# Altium project 数码管灯.PrjPcb
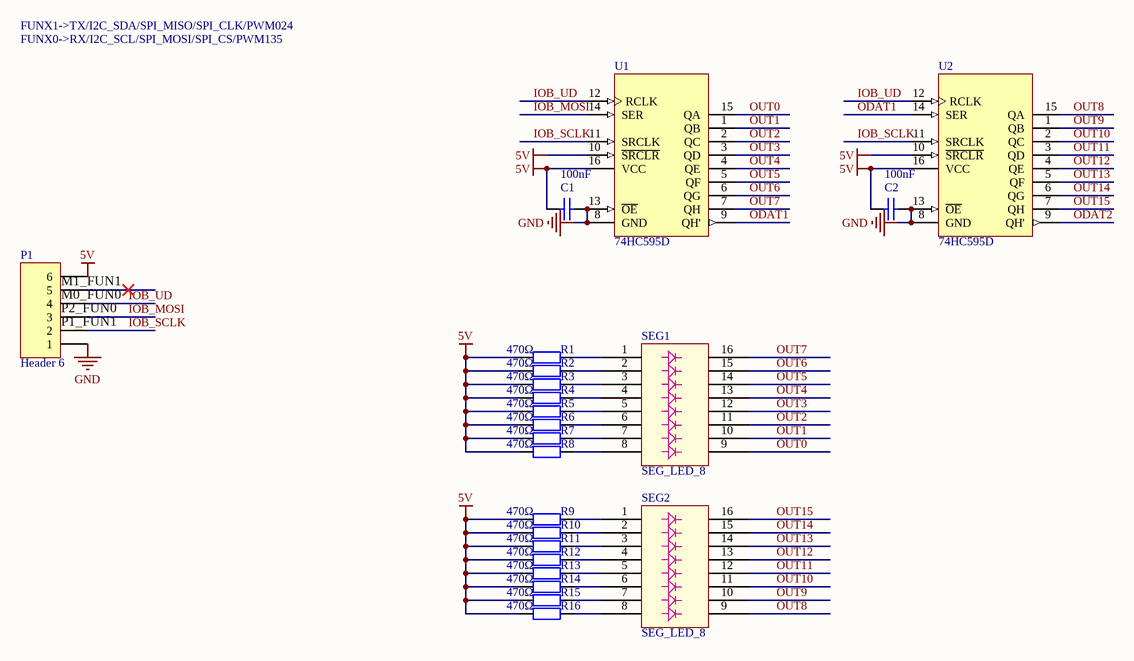
[diagram p0: 数码管灯.SchDoc]
1 sheet, 23 parts. Net scope: global (net labels, ports and power ports of the same name join across sheets).
Board file: 数码管灯.PcbDoc

## Sheet 数码管灯.SchDoc
size A4

### Parts
C1  100nF  [LC-0603_C]
C2  100nF  [LC-0603_C]
P1  Header 6  [MX 1.25-LS-6P]
R1  470Ω  [LC-0805_R]
R2  470Ω  [LC-0805_R]
R3  470Ω  [LC-0805_R]
R4  470Ω  [LC-0805_R]
R5  470Ω  [LC-0805_R]
R6  470Ω  [LC-0805_R]
R7  470Ω  [LC-0805_R]
R8  470Ω  [LC-0805_R]
R9  470Ω  [LC-0805_R]
R10  470Ω  [LC-0805_R]
R11  470Ω  [LC-0805_R]
R12  470Ω  [LC-0805_R]
R13  470Ω  [LC-0805_R]
R14  470Ω  [LC-0805_R]
R15  470Ω  [LC-0805_R]
R16  470Ω  [LC-0805_R]
SEG1  SEG_LED_8  [SEG_LEDx8]
SEG2  SEG_LED_8  [SEG_LEDx8]
U1  74HC595D  [LC-SOIC-16_150mil-3D]
U2  74HC595D  [LC-SOIC-16_150mil-3D]

### Nets
5V: C1.2 C2.2 P1.6 R1.1 R2.1 R3.1 R4.1 R5.1 R6.1 R7.1 R8.1 R9.1 R10.1 R11.1 R12.1 R13.1 R14.1 R15.1 R16.1 U1.10(~{SRCLR}) U1.16(VCC) U2.10(~{SRCLR}) U2.16(VCC)
GND: C1.1 C2.1 P1.1 U1.8(GND) U1.13(~{OE}) U2.8(GND) U2.13(~{OE})
IOB_MOSI: P1.3 U1.14(SER)
IOB_SCLK: P1.2 U1.11(SRCLK) U2.11(SRCLK)
IOB_UD: P1.4 U1.12(RCLK) U2.12(RCLK)
ODAT1: U1.9(QH') U2.14(SER)
ODAT2: U2.9(QH')
OUT0: SEG1.9 U1.15(QA)
OUT1: SEG1.10 U1.1(QB)
OUT2: SEG1.11 U1.2(QC)
OUT3: SEG1.12 U1.3(QD)
OUT4: SEG1.13 U1.4(QE)
OUT5: SEG1.14 U1.5(QF)
OUT6: SEG1.15 U1.6(QG)
OUT7: SEG1.16 U1.7(QH)
OUT8: SEG2.9 U2.15(QA)
OUT9: SEG2.10 U2.1(QB)
OUT10: SEG2.11 U2.2(QC)
OUT11: SEG2.12 U2.3(QD)
OUT12: SEG2.13 U2.4(QE)
OUT13: SEG2.14 U2.5(QF)
OUT14: SEG2.15 U2.6(QG)
OUT15: SEG2.16 U2.7(QH)
NetR1_2: R1.2 SEG1.1
NetR2_2: R2.2 SEG1.2
NetR3_2: R3.2 SEG1.3
NetR4_2: R4.2 SEG1.4
NetR5_2: R5.2 SEG1.5
NetR6_2: R6.2 SEG1.6
NetR7_2: R7.2 SEG1.7
NetR8_2: R8.2 SEG1.8
NetR9_2: R9.2 SEG2.1
NetR10_2: R10.2 SEG2.2
NetR11_2: R11.2 SEG2.3
NetR12_2: R12.2 SEG2.4
NetR13_2: R13.2 SEG2.5
NetR14_2: R14.2 SEG2.6
NetR15_2: R15.2 SEG2.7
NetR16_2: R16.2 SEG2.8

Not connected (* = marked no-connect by the designer): P1 5*

### Notes on the sheet
- FUNX1->TX/I2C_SDA/SPI_MISO/SPI_CLK/PWM024
- FUNX0->RX/I2C_SCL/SPI_MOSI/SPI_CS/PWM135
- (near P1) M0_FUN0
- (near P1) M1_FUN1
- (near P1) P1_FUN1
- (near P1) P2_FUN0

### Library data of the parts
C1 C2 = 0603 100nF (104) 10% 50V: 贴片电容; ComponentLink1Description: 供应商链接; ComponentLink1URL: http://www.szlcsc.com/product/details_15331.html; Package: 0603; Supplier: LC; SuppliersPartNumber: C14663
P1 = Header 6: Header, 6-Pin; LatestRevisionDate: 17-Jul-2002; LatestRevisionNote: Re-released for DXP Platform.; Publisher: Altium Limited
R1-R16 = 0805 470Ω (4700) 1%: 贴片电阻; ComponentLink1Description: 供应商链接; ComponentLink1URL: http://www.szlcsc.com/product/details_18398.html; Package: 0805; Supplier: LC; SuppliersPartNumber: C17710
U1 U2 = 74HC595D: 74系列逻辑芯片; ComponentLink1Description: 供应商链接; ComponentLink1URL: http://www.szlcsc.com/product/details_6413.html; Package: SOIC-16_150mil; Supplier: LC; SuppliersPartNumber: C5947